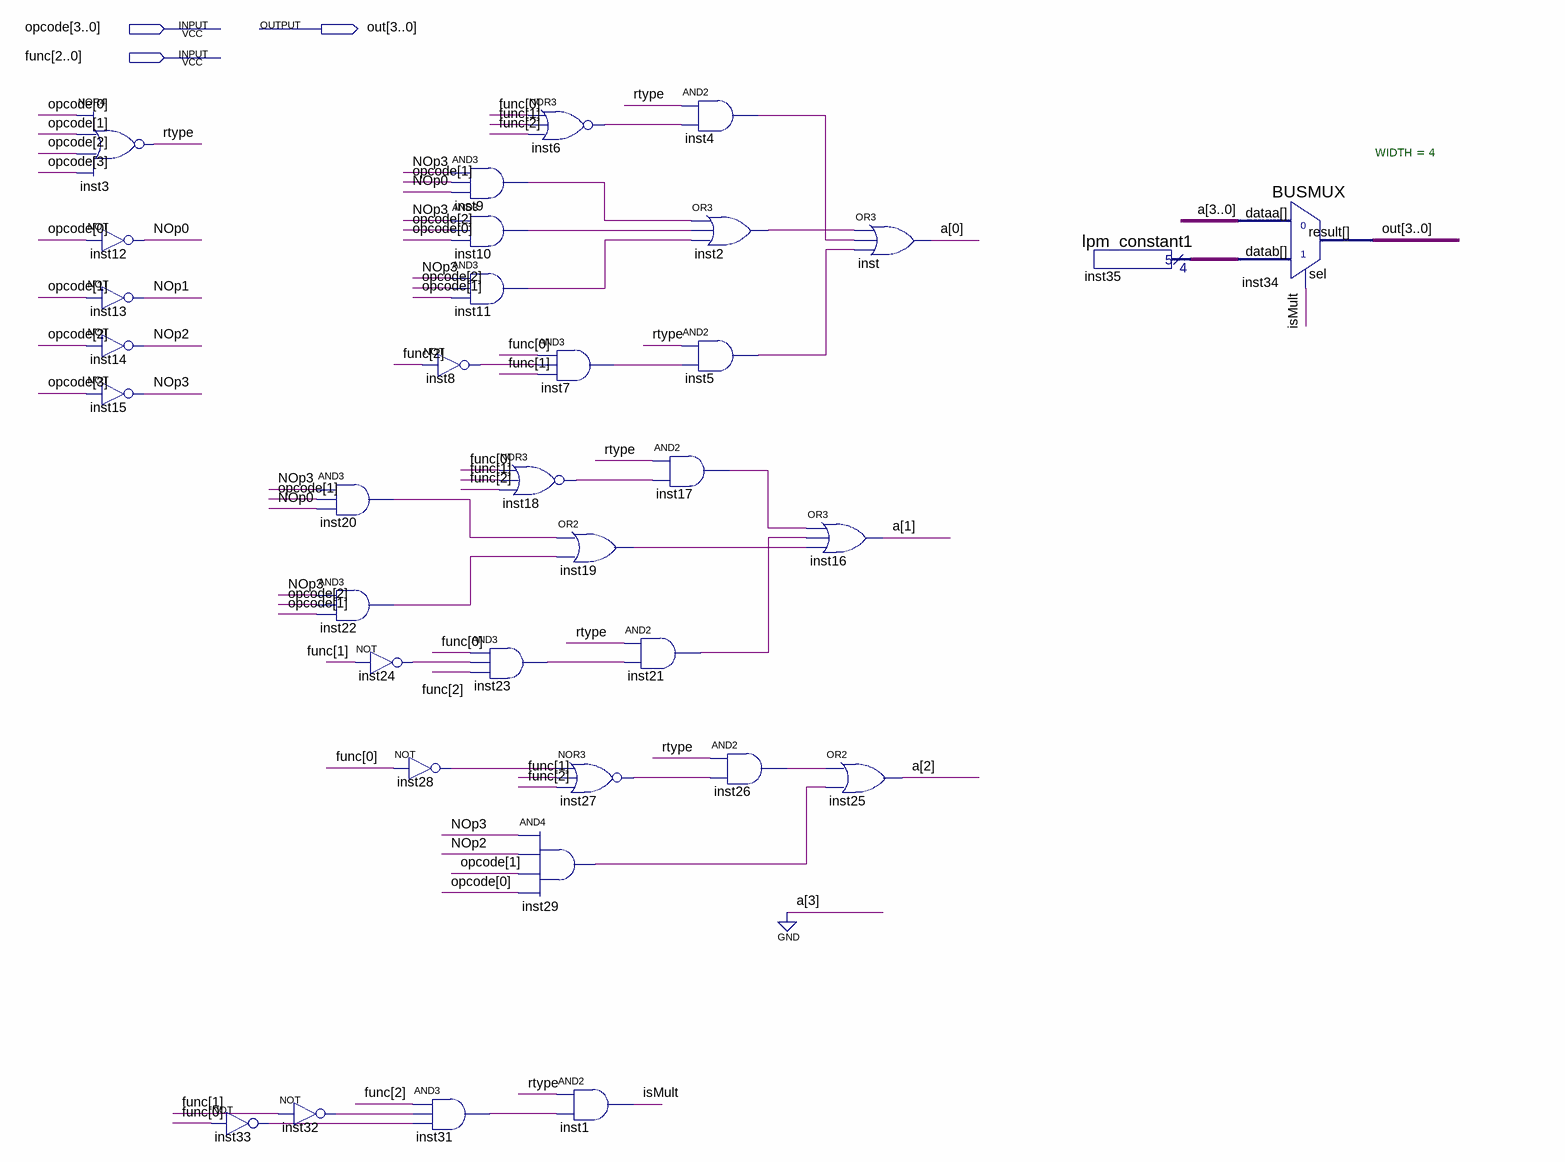
[diagram p0: schematic sheet]
// Quartus schematic ALUControl.bdf as structural Verilog: 35 symbols, 3 pins
module ALUControl (
  input  [3:0] opcode,
  input  [2:0] func,
  output [3:0] out
);

  wire inst2_out, inst4_out, inst5_out, inst6_out, inst7_out, inst8_out, inst9_out, inst10_out, inst11_out,
       inst17_out, inst18_out, inst19_out, inst20_out, inst21_out, inst22_out, inst23_out, inst24_out,
       inst26_out, inst27_out, inst28_out, inst29_out, inst31_out, inst32_out, inst33_out, isMult, NOp0,
       NOp1, NOp2, NOp3, rtype;
  wire [2:0] a;
  wire [3:0] inst35_result;

  nor inst3 (rtype, opcode[0], opcode[1], opcode[2], opcode[3]);
  not inst12 (NOp0, opcode[0]);
  not inst13 (NOp1, opcode[1]);
  not inst14 (NOp2, opcode[2]);
  not inst15 (NOp3, opcode[3]);
  not inst33 (inst33_out, func[0]);
  and inst20 (inst20_out, NOp3, opcode[1], NOp0);
  and inst22 (inst22_out, NOp3, opcode[2], opcode[1]);
  not inst32 (inst32_out, func[1]);
  not inst24 (inst24_out, func[1]);
  not inst28 (inst28_out, func[0]);
  and inst31 (inst31_out, func[2], inst32_out, inst33_out);
  and inst9 (inst9_out, NOp3, opcode[1], NOp0);
  and inst10 (inst10_out, NOp3, opcode[2], opcode[0]);
  and inst11 (inst11_out, NOp3, opcode[2], opcode[1]);
  not inst8 (inst8_out, func[2]);
  and inst23 (inst23_out, func[0], inst24_out, func[2]);
  nor inst6 (inst6_out, func[0], func[1], func[2]);
  and inst7 (inst7_out, func[0], inst8_out, func[1]);
  nor inst18 (inst18_out, func[0], func[1], func[2]);
  or inst19 (inst19_out, inst20_out, inst22_out);
  nor inst27 (inst27_out, inst28_out, func[1], func[2]);
  and inst29 (inst29_out, NOp3, NOp2, opcode[1], opcode[0]);
  and inst1 (isMult, rtype, inst31_out);
  and inst21 (inst21_out, rtype, inst23_out);
  and inst4 (inst4_out, rtype, inst6_out);
  or inst2 (inst2_out, inst9_out, inst10_out, inst11_out);
  and inst5 (inst5_out, rtype, inst7_out);
  and inst17 (inst17_out, rtype, inst18_out);
  and inst26 (inst26_out, rtype, inst27_out);
  or inst (a[0], inst2_out, inst4_out, inst5_out);
  or inst16 (a[1], inst17_out, inst21_out, inst19_out);
  or inst25 (a[2], inst26_out, inst29_out);
  lpm_constant1 inst35 (.result(inst35_result));
  BUSMUX #(.WIDTH(4)) inst34 (.datab(inst35_result), .sel(isMult), .dataa({1'b0, a}), .result(out));
endmodule
